# Altium schematic sheet USB_TTL_converter.SchDoc
size A3; SheetNumber: 14; SheetTotal: 18
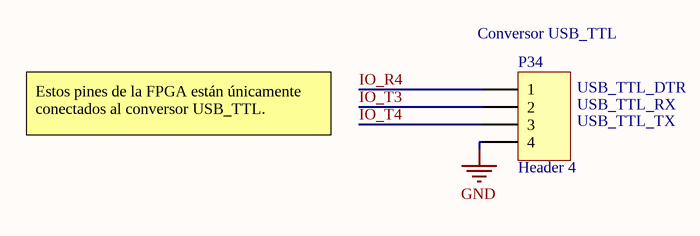
[diagram p0: USB_TTL_converter.SchDoc]

## Parts
P34  Header 4  [HDR1X4]

## Nets
GND: P34.4
IO_R4: P34.1
IO_T3: P34.2
IO_T4: P34.3

## Notes on the sheet
- (near P34) Conversor USB_TTL
- (near P34) USB_TTL_DTR
- (near P34) USB_TTL_RX
- Estos pines de la FPGA están únicamente conectados al conversor USB_TTL.
- (near P34) USB_TTL_TX

## Library data of the parts
P34 = Header 4: Header, 4-Pin; LatestRevisionDate: 17-Jul-2002; LatestRevisionNote: Re-released for DXP Platform.; Publisher: Altium Limited